# Altium schematic sheet Power.SchDoc
size B; SheetNumber: 3; SheetTotal: 5
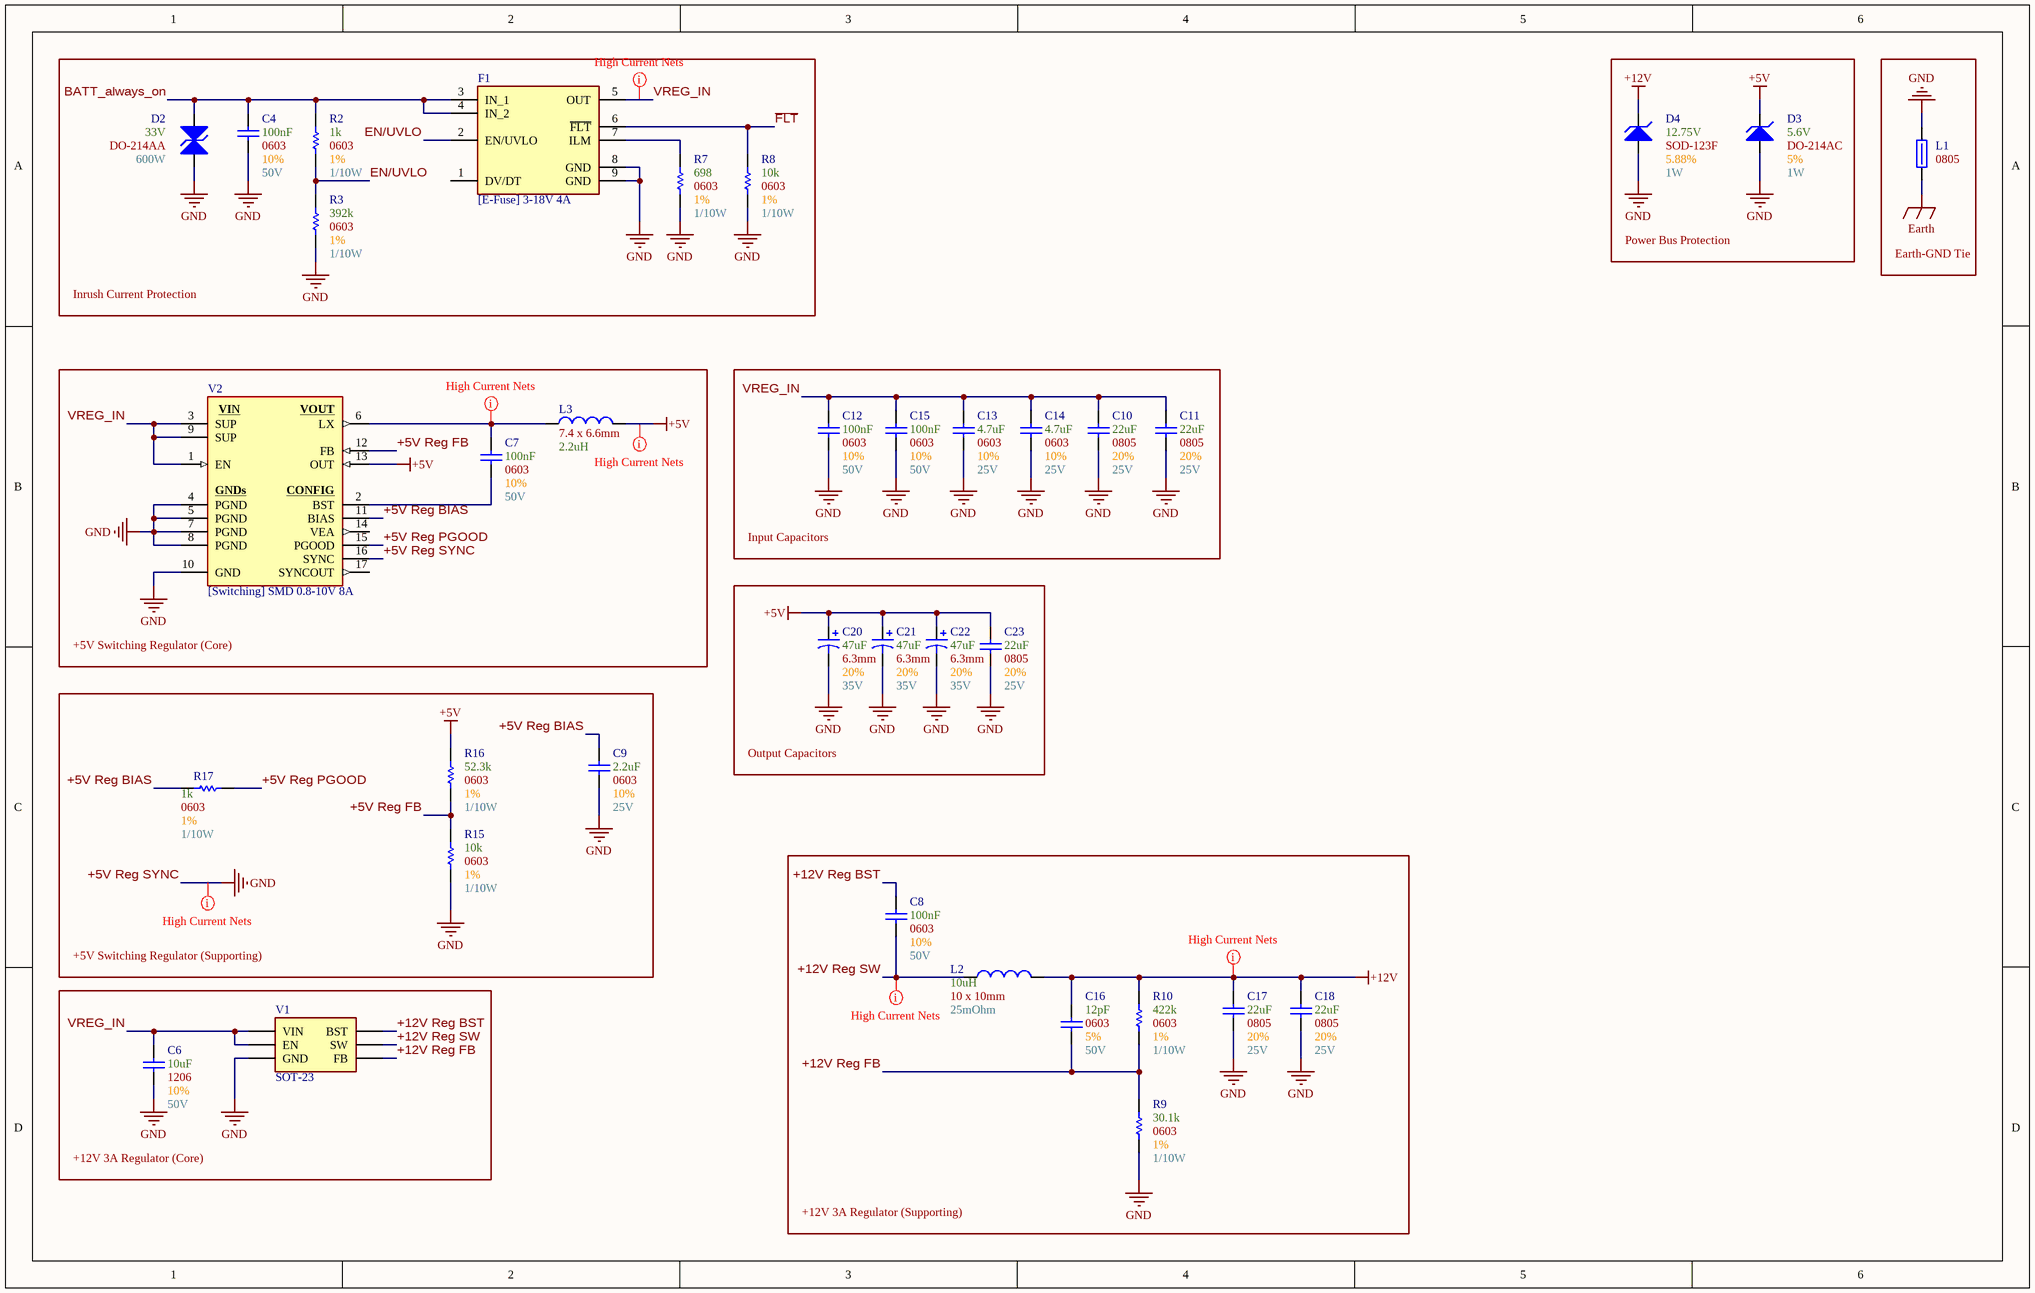
[diagram p0: Power.SchDoc]

## Parts
C4  Max Voltage: 50V  Size Package: 0603  Tolerance: 10%  Capacitance: 100nF  [[Cap] SMD 0603]  (hidden comment: [Cap] 0603 0.1uF 10% 50V)
C6  Max Voltage: 50V  Size Package: 1206  Tolerance: 10%  Capacitance: 10uF  [[Cap] SMD 1206]  (hidden comment: [Cap] 1206 10uF 20% 50V)
C7  Max Voltage: 50V  Size Package: 0603  Tolerance: 10%  Capacitance: 100nF  [[Cap] SMD 0603]  (hidden comment: [Cap] 0603 0.1uF 10% 50V)
C8  Max Voltage: 50V  Size Package: 0603  Tolerance: 10%  Capacitance: 100nF  [[Cap] SMD 0603]  (hidden comment: [Cap] 0603 0.1uF 10% 50V)
C9  Max Voltage: 25V  Size Package: 0603  Tolerance: 10%  Capacitance: 2.2uF  [[Cap] SMD 0603]  (hidden comment: [Cap] 0603 2.2uF 10% 25V)
C10  Max Voltage: 25V  Size Package: 0805  Tolerance: 20%  Capacitance: 22uF  [[Cap] SMD 0805]  (hidden comment: [Cap] 0805 22uF 20% 25V)
C11  Max Voltage: 25V  Size Package: 0805  Tolerance: 20%  Capacitance: 22uF  [[Cap] SMD 0805]  (hidden comment: [Cap] 0805 22uF 20% 25V)
C12  Max Voltage: 50V  Size Package: 0603  Tolerance: 10%  Capacitance: 100nF  [[Cap] SMD 0603]  (hidden comment: [Cap] 0603 0.1uF 10% 50V)
C13  Max Voltage: 25V  Size Package: 0603  Tolerance: 10%  Capacitance: 4.7uF  [[Cap] SMD 0603]  (hidden comment: [Cap] 0603 4.7uF 10% 25V)
C14  Max Voltage: 25V  Size Package: 0603  Tolerance: 10%  Capacitance: 4.7uF  [[Cap] SMD 0603]  (hidden comment: [Cap] 0603 4.7uF 10% 25V)
C15  Max Voltage: 50V  Size Package: 0603  Tolerance: 10%  Capacitance: 100nF  [[Cap] SMD 0603]  (hidden comment: [Cap] 0603 0.1uF 10% 50V)
C16  Max Voltage: 50V  Size Package: 0603  Tolerance: 5%  Capacitance: 12pF  [[Cap] SMD 0603]  (hidden comment: [Cap] 0603 12pF 5% 50V)
C17  Max Voltage: 25V  Size Package: 0805  Tolerance: 20%  Capacitance: 22uF  [[Cap] SMD 0805]  (hidden comment: [Cap] 0805 22uF 20% 25V)
C18  Max Voltage: 25V  Size Package: 0805  Tolerance: 20%  Capacitance: 22uF  [[Cap] SMD 0805]  (hidden comment: [Cap] 0805 22uF 20% 25V)
C20  Max Voltage: 35V  Size Package: 6.3mm  Tolerance: 20%  Capacitance: 47uF  [[Cap] SMD Polarized, 6.3mm]  (hidden comment: [Cap] 6.3mm 47uF 20% 35V)
C21  Max Voltage: 35V  Size Package: 6.3mm  Tolerance: 20%  Capacitance: 47uF  [[Cap] SMD Polarized, 6.3mm]  (hidden comment: [Cap] 6.3mm 47uF 20% 35V)
C22  Max Voltage: 35V  Size Package: 6.3mm  Tolerance: 20%  Capacitance: 47uF  [[Cap] SMD Polarized, 6.3mm]  (hidden comment: [Cap] 6.3mm 47uF 20% 35V)
C23  Max Voltage: 25V  Size Package: 0805  Tolerance: 20%  Capacitance: 22uF  [[Cap] SMD 0805]  (hidden comment: [Cap] 0805 22uF 20% 25V)
D2  Wattage: 600W  Optimal Zener Voltage: 33V  [[Diode] SMD DO-214AA]  (hidden comment: DO-214AA)
D3  Tolerance: 5%  Wattage: 1W  Optimal Zener Voltage: 5.6V  [[Diode] SMD DO-214AC]  (hidden comment: DO-214AC)
D4  Tolerance: 5.88%  Wattage: 1W  Optimal Zener Voltage: 12.75V  [[Diode] SOD-123F]  (hidden comment: SOD-123F)
F1  [E-Fuse] 3-18V 4A  [[E-Fuse] 3-18V 4A]
L1  Size Package: 0805  [[Ferrite] SMD 0805]  (hidden comment: 652-MH2029-300Y)
L2  DC Resistance: 25mOhm  Package: 10 x 10mm  Inductance: 10uH  [[10uH] SMD Nonstandard 3.8A]  (hidden comment: [10uH] SMD Nonstandard 3.8A)
L3  Package: 7.4 x 6.6mm  Inductance: 2.2uH  [[Inductor] SMD 7.4 X 6.6 X 3 MM]  (hidden comment: [2.2uH] SMD Nonstandard 10A)
R2  Wattage: 1/10W  Tolerance: 1%  Resistance: 1k  Size Package: 0603  [[Res] SMD 0603]  (hidden comment: [1k] SMD 0603 1% 1/10W)
R3  Wattage: 1/10W  Tolerance: 1%  Resistance: 392k  Size Package: 0603  [[Res] SMD 0603]  (hidden comment: [392k] SMD 0603 1% 1/10W)
R7  Wattage: 1/10W  Tolerance: 1%  Resistance: 698  Size Package: 0603  [[Res] SMD 0603]  (hidden comment: [698] SMD 0603 1% 1/10W_1)
R8  Wattage: 1/10W  Tolerance: 1%  Resistance: 10k  Size Package: 0603  [[Res] SMD 0603]  (hidden comment: [10k] SMD 0603 1% 1/8W)
R9  Wattage: 1/10W  Tolerance: 1%  Resistance: 30.1k  Size Package: 0603  [[Res] SMD 0603]  (hidden comment: [30.1k] SMD 0603 1% 1/10W)
R10  Wattage: 1/10W  Tolerance: 1%  Resistance: 422k  Size Package: 0603  [[Res] SMD 0603]  (hidden comment: [422k] SMD 0603 1% 1/10W)
R15  Wattage: 1/10W  Tolerance: 1%  Resistance: 10k  Size Package: 0603  [[Res] SMD 0603]  (hidden comment: [10k] SMD 0603 1% 1/8W)
R16  Wattage: 1/10W  Tolerance: 1%  Resistance: 52.3k  Size Package: 0603  [[Res] SMD 0603]  (hidden comment: [52.3k] SMD 0603 1% 1/10W)
R17  Wattage: 1/10W  Tolerance: 1%  Resistance: 1k  Size Package: 0603  [[Res] SMD 0603]  (hidden comment: [1k] SMD 0603 1% 1/10W)
V1  SOT-23  [SOT-23]
V2  [Switching] SMD 0.8-10V 8A  [[Switching] 17-PowerWFQFN]

## Blocks framed on the sheet
Inrush Current Protection: C4 D2 F1 R2 R3 R7 R8
Power Bus Protection: D3 D4
Earth-GND Tie: L1
+5V Switching Regulator (Core): C7 L3 V2
Input Capacitors: C10-C15
Output Capacitors: C20-C23
+5V Switching Regulator (Supporting): C9 R15-R17
+12V 3A Regulator (Supporting): C8 C16-C18 L2 R9 R10
+12V 3A Regulator (Core): C6 V1

## Nets
+5V: C20.1 C21.1 C22.1 C23.2 D3.1(K) L3.2 R16.2 V2.13(OUT)
+5V Reg SYNC: C4.1 C6.1 C9.1 C10.1 C11.1 C12.1 C13.1 C14.1 C15.1 C17.1 C18.1 C20.2 C21.2 C22.2 C23.1 D2.1(A) D3.2(A) D4.2(A) F1.8(GND) F1.9(GND) L1.2 R3.1 R7.1 R8.1 R9.1 R15.1 V1.4(GND) V2.4(PGND) V2.5(PGND) V2.7(PGND) V2.8(PGND) V2.10(GND) V2.16(SYNC)  [also labelled GND]
+12V: C16.2 C17.2 C18.2 D4.1(K) L2.2 R10.2
Earth: L1.1
+5V Reg BIAS: C9.2 R17.1 V2.11(BIAS)
+5V Reg FB: R15.2 R16.1 V2.12(FB)
+5V Reg PGOOD: R17.2 V2.15(PGOOD)
+12V Reg BST: C8.2 V1.6(BST)
+12V Reg FB: C16.1 R9.2 R10.1 V1.1(FB)
+12V Reg SW: C8.1 L2.1 V1.5(SW)
~{FLT}: F1.6(~{FLT}) R8.2
BATT_always_on: C4.2 D2.2(K) F1.3(IN_1) F1.4(IN_2) R2.2
EN/UVLO: F1.2(EN/UVLO) R2.1 R3.2
VREG_IN: C6.2 C10.2 C11.2 C12.2 C13.2 C14.2 C15.2 F1.5(OUT) V1.2(EN) V1.3(VIN) V2.1(EN) V2.3(SUP) V2.9(SUP)
NetC7_1: C7.1 V2.2(BST)
NetC7_2: C7.2 L3.1 V2.6(LX)
NetF1_7: F1.7(ILM) R7.2

Not connected (* = marked no-connect by the designer): F1 1(DV/DT); V2 14(VEA) 17(SYNCOUT)

## Layout directives
net class High_Current_Nets: +5V, +5V Reg SYNC, +12V, +12V Reg SW, NetC7_2, VREG_IN

## Notes on the sheet
- (in symbol [Switching] SMD 0.8-10V 8A) VIN; VOUT; GNDs; CONFIG

## Library data of the parts
C4 C7 C8 C12 C15 = [Cap] 0603 0.1uF 10% 50V: CL10B104KB8NNNC; Supplier 1: DigiKey; Supplier Part Number 1: 1276-1000-6-ND
C6 = [Cap] 1206 10uF 20% 50V: CGA5L3X5R1H106M160AB; Supplier 1: DigiKey; Supplier Part Number 1: 445-12883-6-ND
C9 = [Cap] 0603 2.2uF 10% 25V: GRM188R61E225KA12D; Supplier 1: DigiKey; Supplier Part Number 1: 490-10731-1-ND
C10 C11 C17 C18 C23 = [Cap] 0805 22uF 20% 25V: CL21A226MAYNNWE; Supplier 1: DigiKey; Supplier Part Number 1: 1276-CL21A226MAYNNWECT-ND
C13 C14 = [Cap] 0603 4.7uF 10% 25V: GRM188R61E475KE11D; Supplier 1: DigiKey; Supplier Part Number 1: 490-7203-6-ND
C16 = [Cap] 0603 12pF 5% 50V: C0603C120J5GACTU; Supplier 1: DigiKey; Supplier Part Number 1: 399-C0603C120J5GACTUCT-ND
C20-C22 = [Cap] 6.3mm 47uF 20% 35V: UWT1V470MCL1GS; Supplier 1: DigiKey; Supplier Part Number 1: 493-2202-1-ND
D2 = [TVS] SMBJ33CA: SMBJ33CA; Supplier 1: DigiKey; Supplier Part Number 1: SMBJ33CA-FDICT-ND; Footprint: DO-214AA
D3 = [Zener] SMD 5.6V 1W 5%: SMAZ5V6-13-F; Supplier 1: DigiKey; Supplier Part Number 1: SMAZ5V6-FDICT-ND; Footprint: DO-214AC
D4 = [Zener] SMD 12.75V 1W 5.88%: KDZVTR12B; Supplier 1: DigiKey; Supplier Part Number 1: KDZVTR12BCT-ND; Footprint: SOD-123F
F1 = [E-Fuse] 3-18V 4A: TPS259571DSGR; Supplier 1: DigiKey; Supplier Part Number 1: 296-50500-1-ND
L1 = [Ferrite] SMD 0805 3A 30ohm: Res @ Freq: 30 @ 100MHz; Supplier 1: DigiKey; Supplier Part Number 1: MH2029-300YCT-ND
L2 = [10uH] SMD Nonstandard 3.8A: SRU1038-100Y; Supplier 1: DigiKey; Supplier Part Number 1: SRU1038-100YCT-ND
L3 = [2.2uH] SMD Nonstandard 10A: ECS-MPIL0630-2R2MC; Supplier 1: DigiKey; Supplier Part Number 1: XC2402CT-ND
R2 R17 = [1k] SMD 0603 1% 1/10W: RMCF0603FT1K00; Supplier 1: DigiKey; Supplier Part Number 1: RMCF0603FT1K00DKR-ND
R3 = [392k] SMD 0603 1% 1/10W: CR0603-FX-3923ELF; Supplier 1: DigiKey; Supplier Part Number 1: 118-CR0603-FX-3923ELFCT-ND
R7 = [698] SMD 0603 1% 1/10W_1: RMCF0603FT698R; Supplier 1: DigiKey; Supplier Part Number 1: RMCF0603FT698RCT-ND
R8 R15 = [10k] SMD 0603 1% 1/8W: RMCF0603FT10K0; Supplier 1: DigiKey; Supplier Part Number 1: RMCF0603FT10K0DKR-ND
R9 = [30.1k] SMD 0603 1% 1/10W: RC0603FR-0730K1L; Supplier 1: DigiKey; Supplier Part Number 1: 311-30.1KHRCT-ND
R10 = [422k] SMD 0603 1% 1/10W: ERJ-3EKF4223V; Supplier 1: DigiKey; Supplier Part Number 1: P422KHDKR-ND
R16 = [52.3k] SMD 0603 1% 1/10W: RC0603FR-0752K3L; Supplier 1: DigiKey; Supplier Part Number 1: 311-52.3KHRCT-ND
V1 = [Switching] SMD 0.8-31V 3A: AP63301WU-7; Supplier 1: DigiKey; Supplier Part Number 1: 31-AP63301WU-7CT-ND
V2 = [Switching] SMD 0.8-10V 8A: MAX20408AFOF/VY+; Supplier 1: DigiKey; Supplier Part Number 1: 505-MAX20408AFOF/VY+-ND